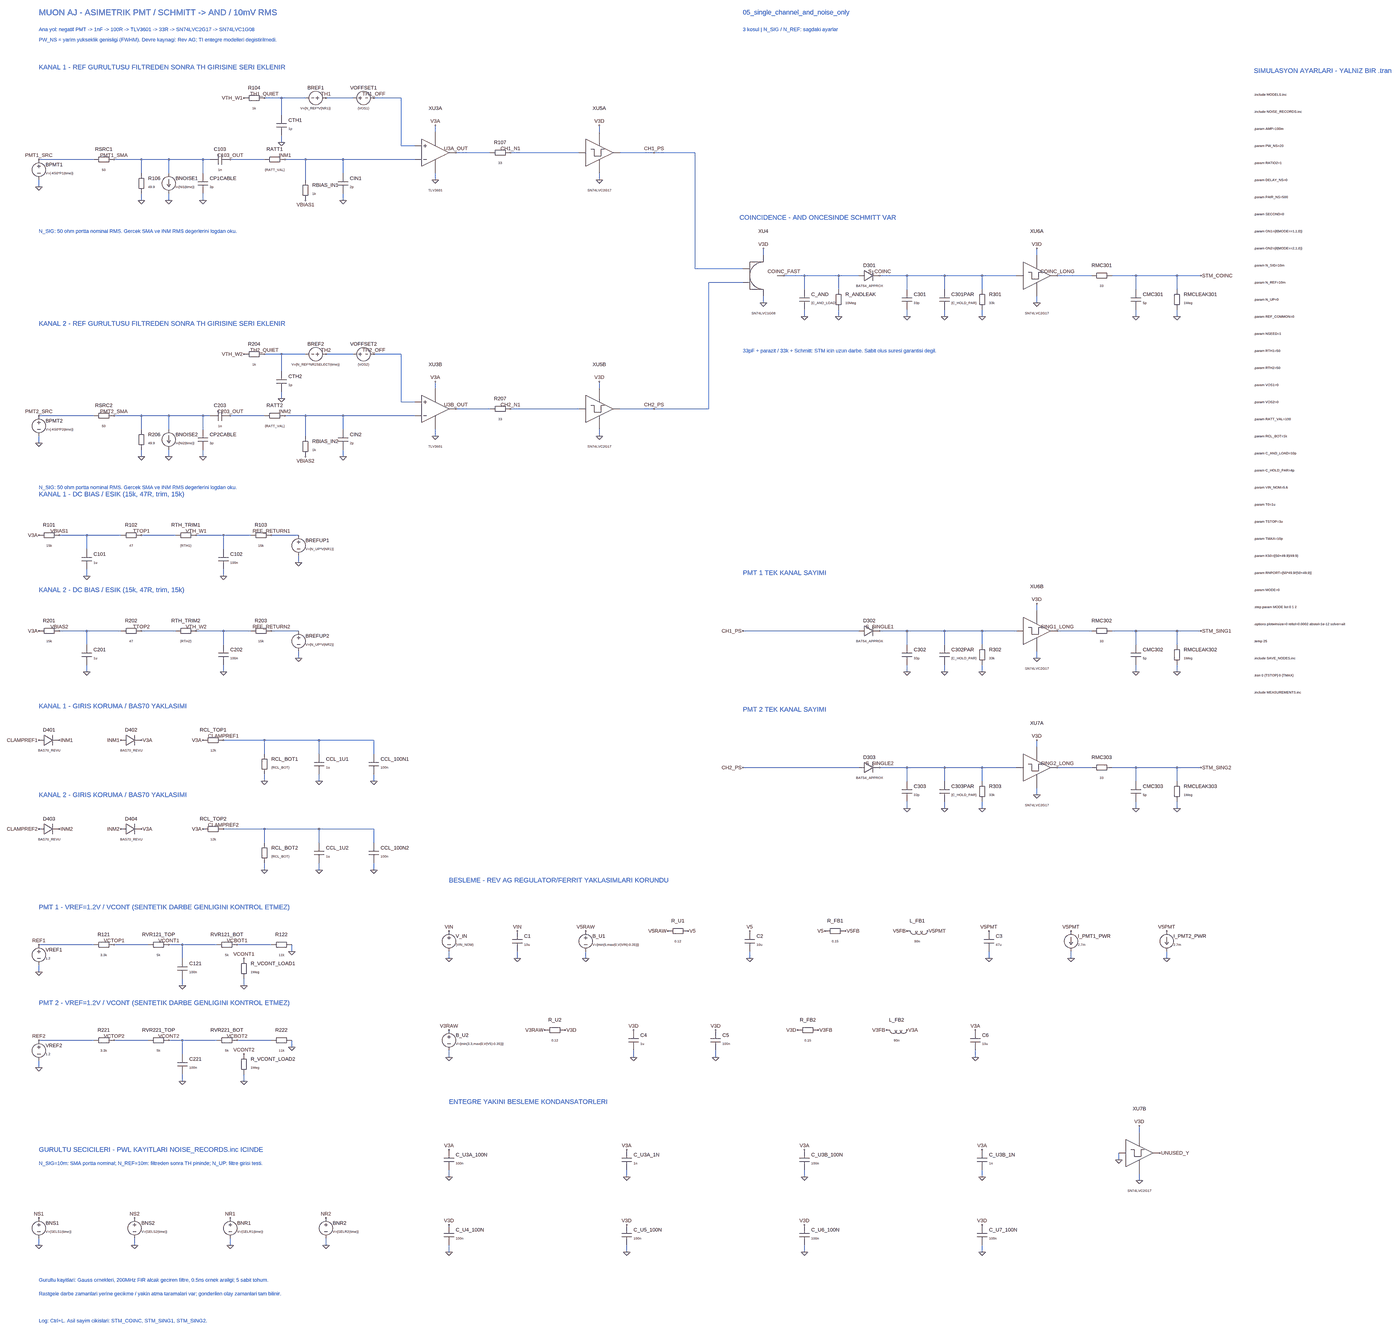
[diagram p0: schematic 05_single_channel_and_noise_only.asc, whole sheet]
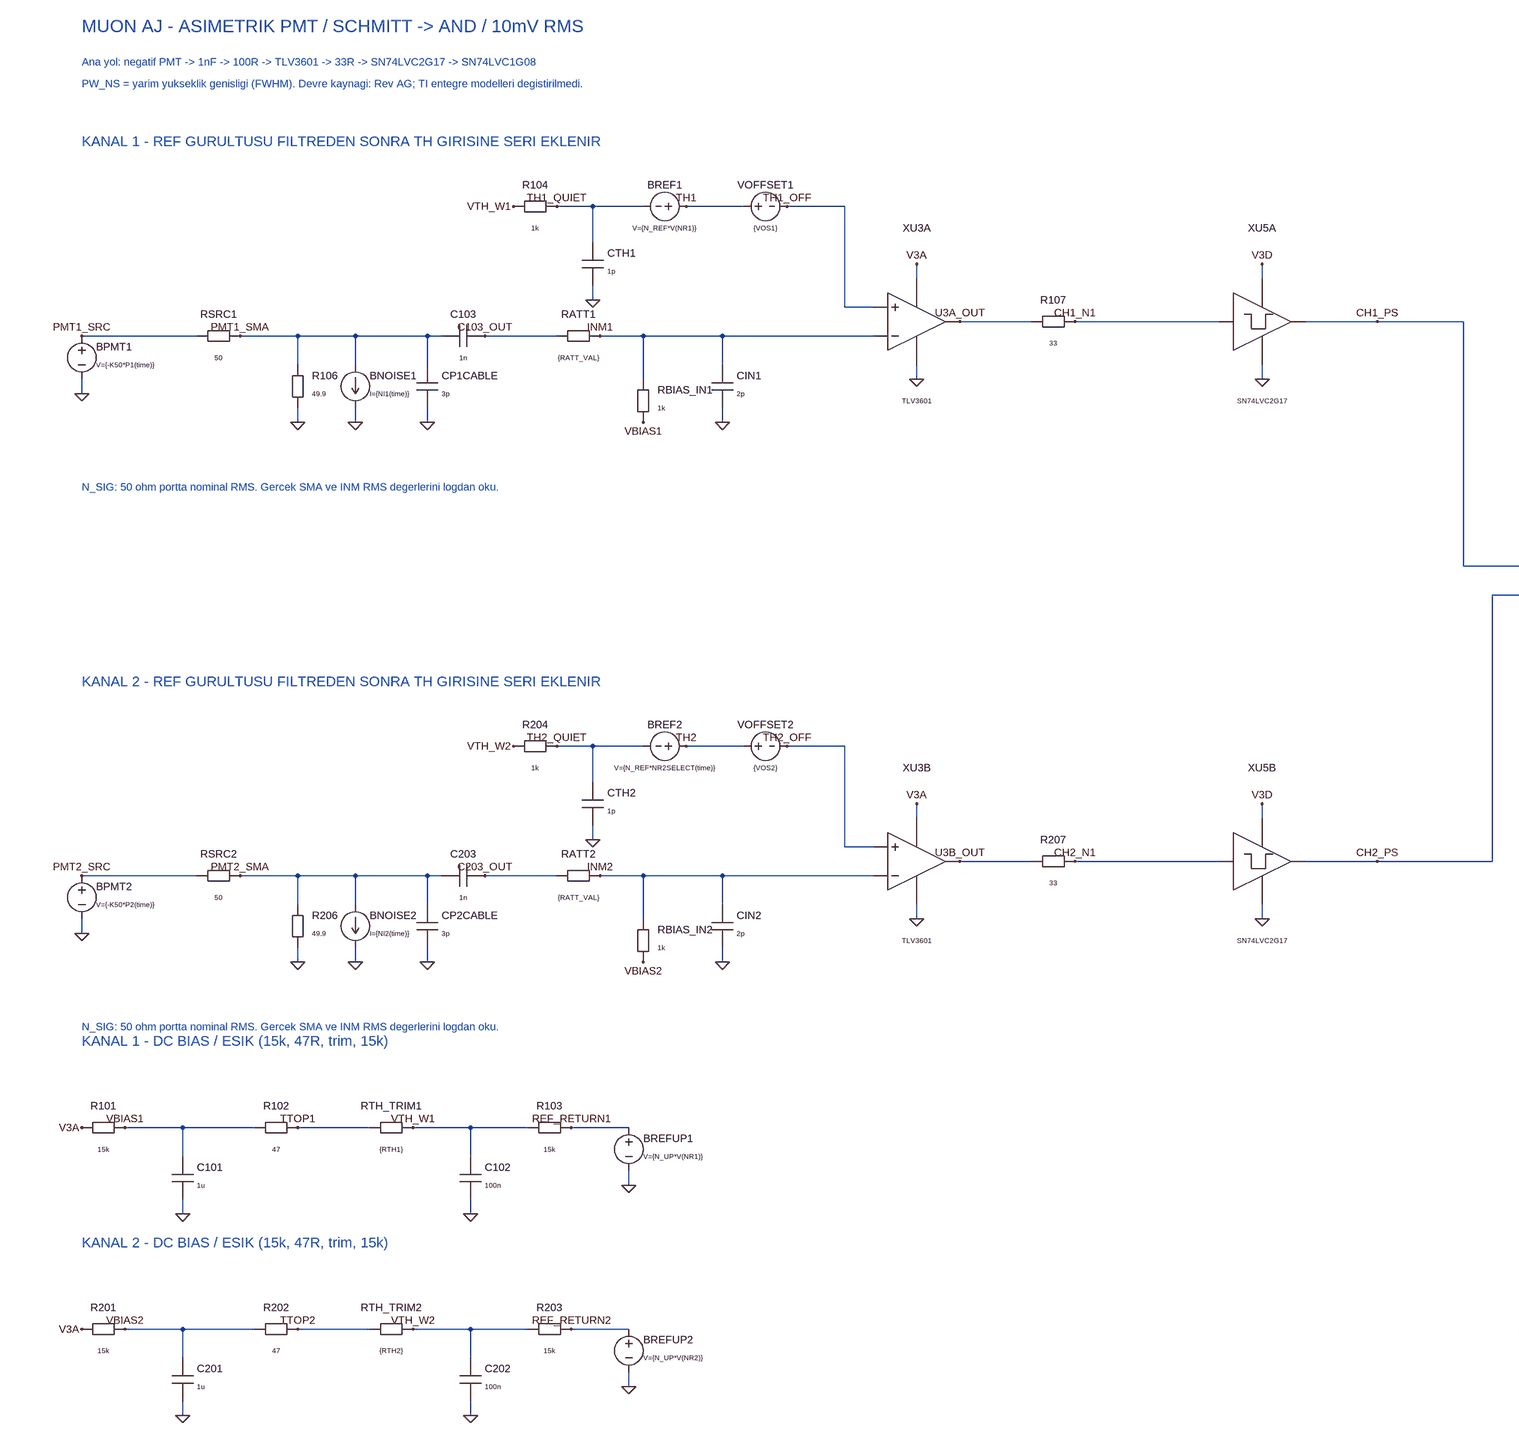
[diagram p1: schematic 05_single_channel_and_noise_only.asc, part, row 1 of 2, column 1 of 2]
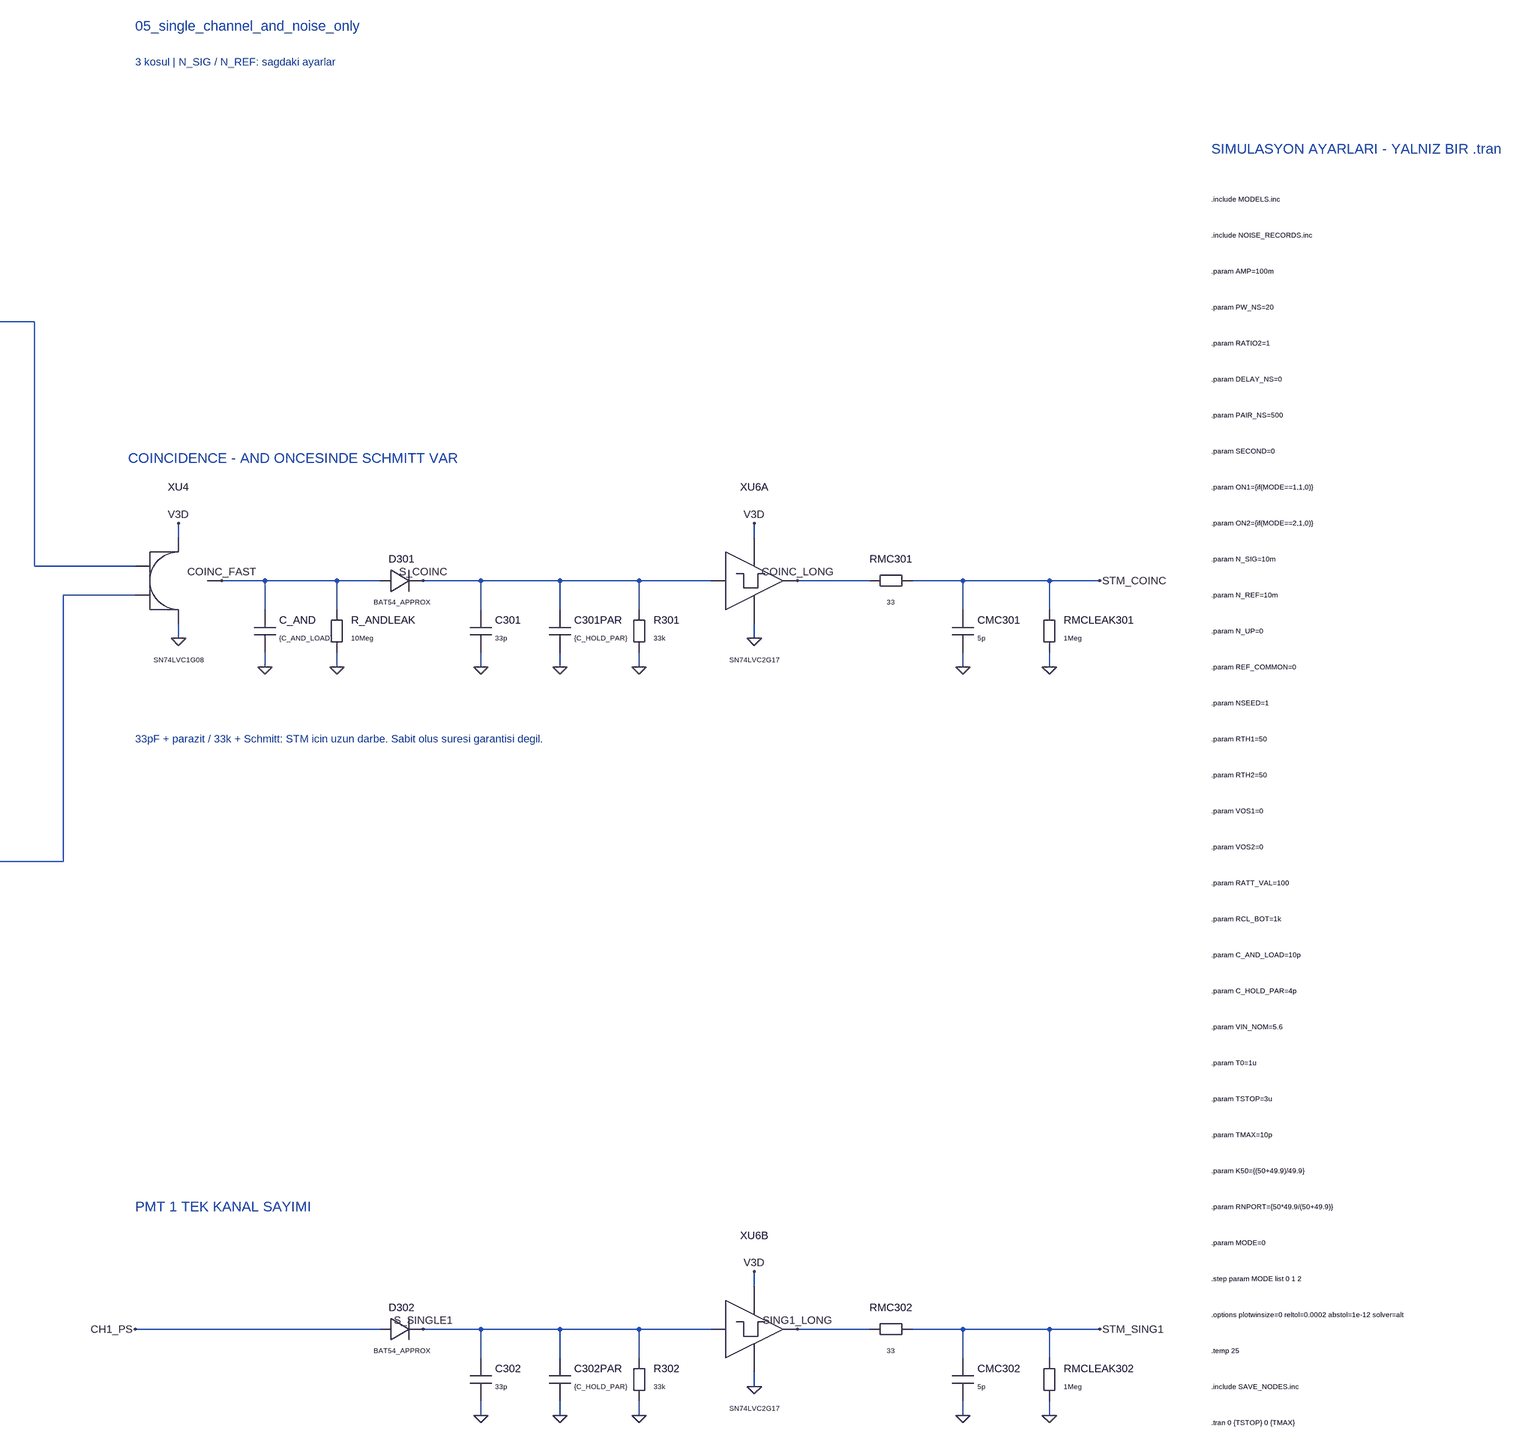
[diagram p2: schematic 05_single_channel_and_noise_only.asc, part, row 1 of 2, column 2 of 2]
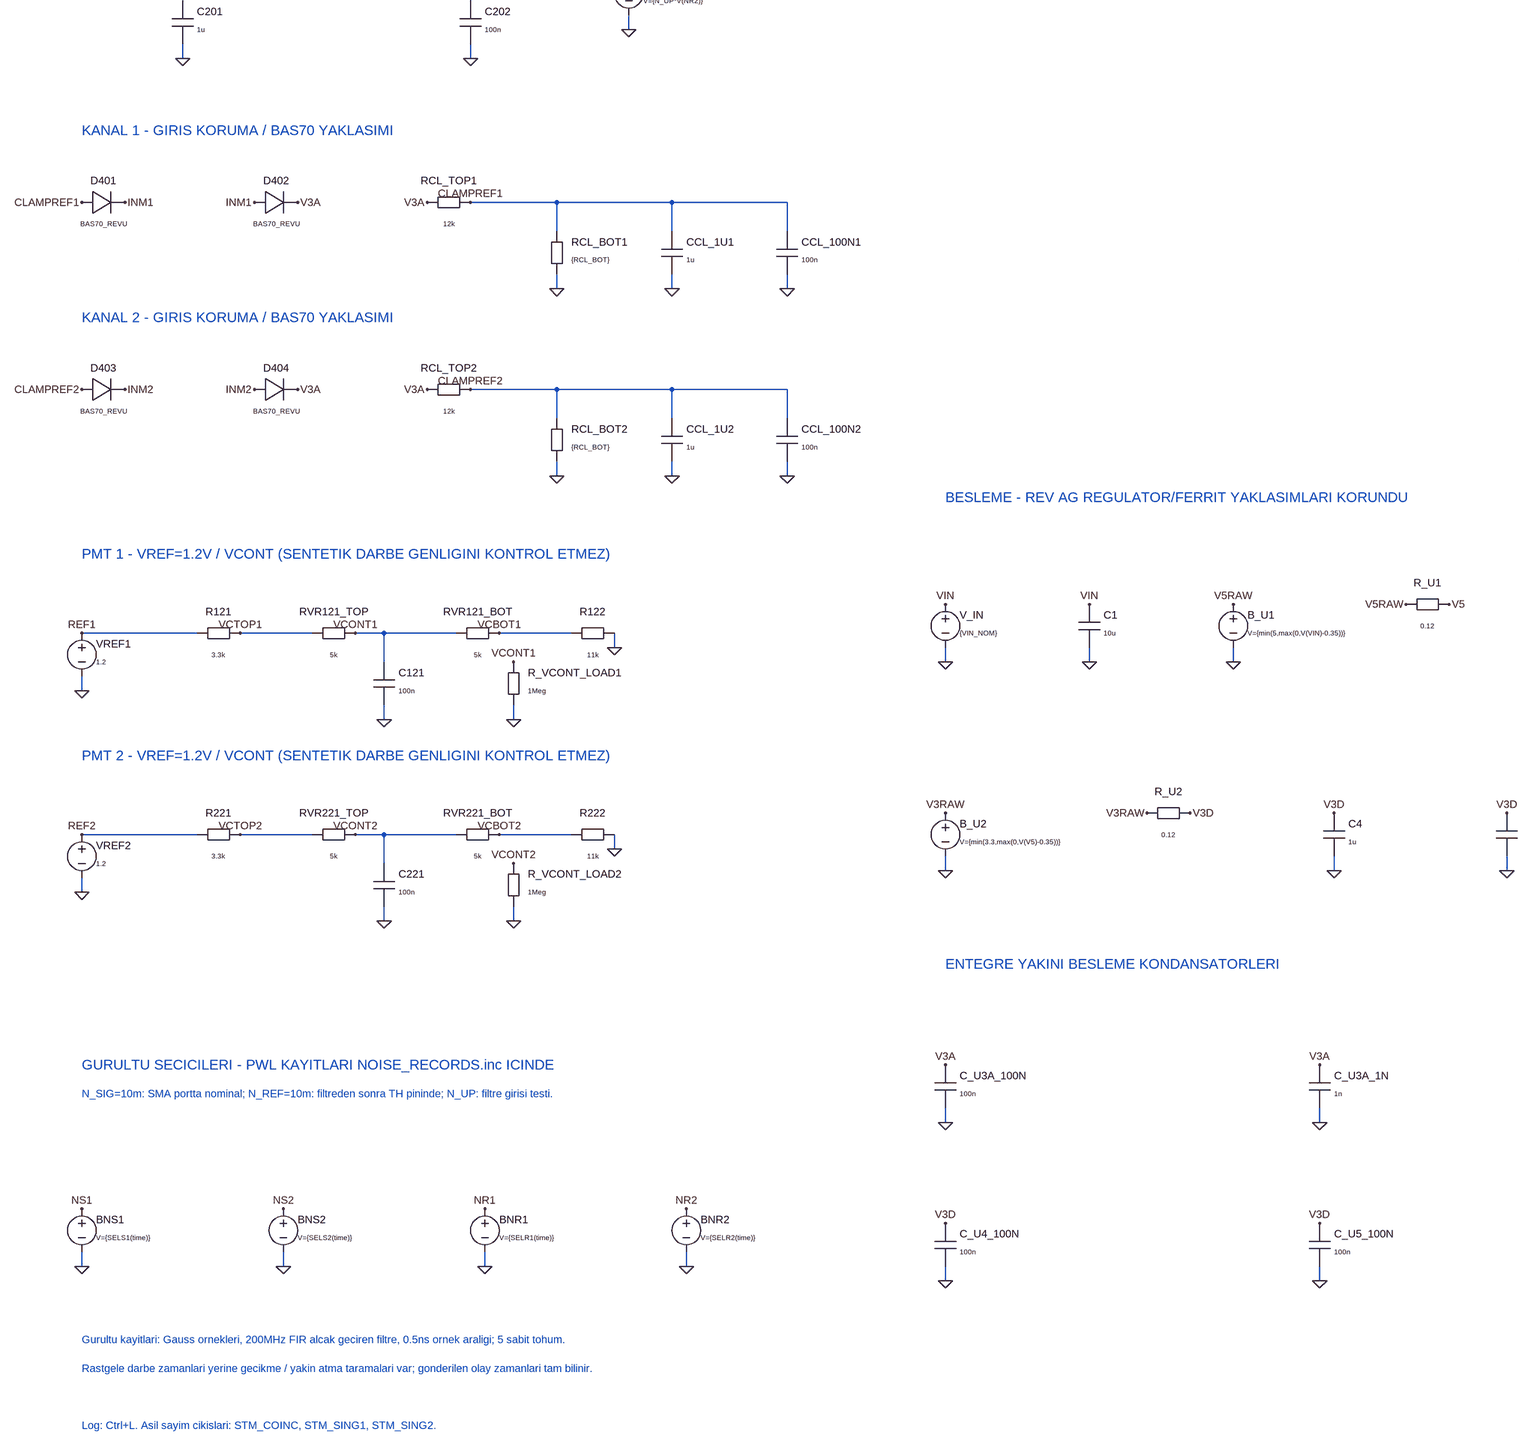
[diagram p3: schematic 05_single_channel_and_noise_only.asc, part, row 2 of 2, column 1 of 2]
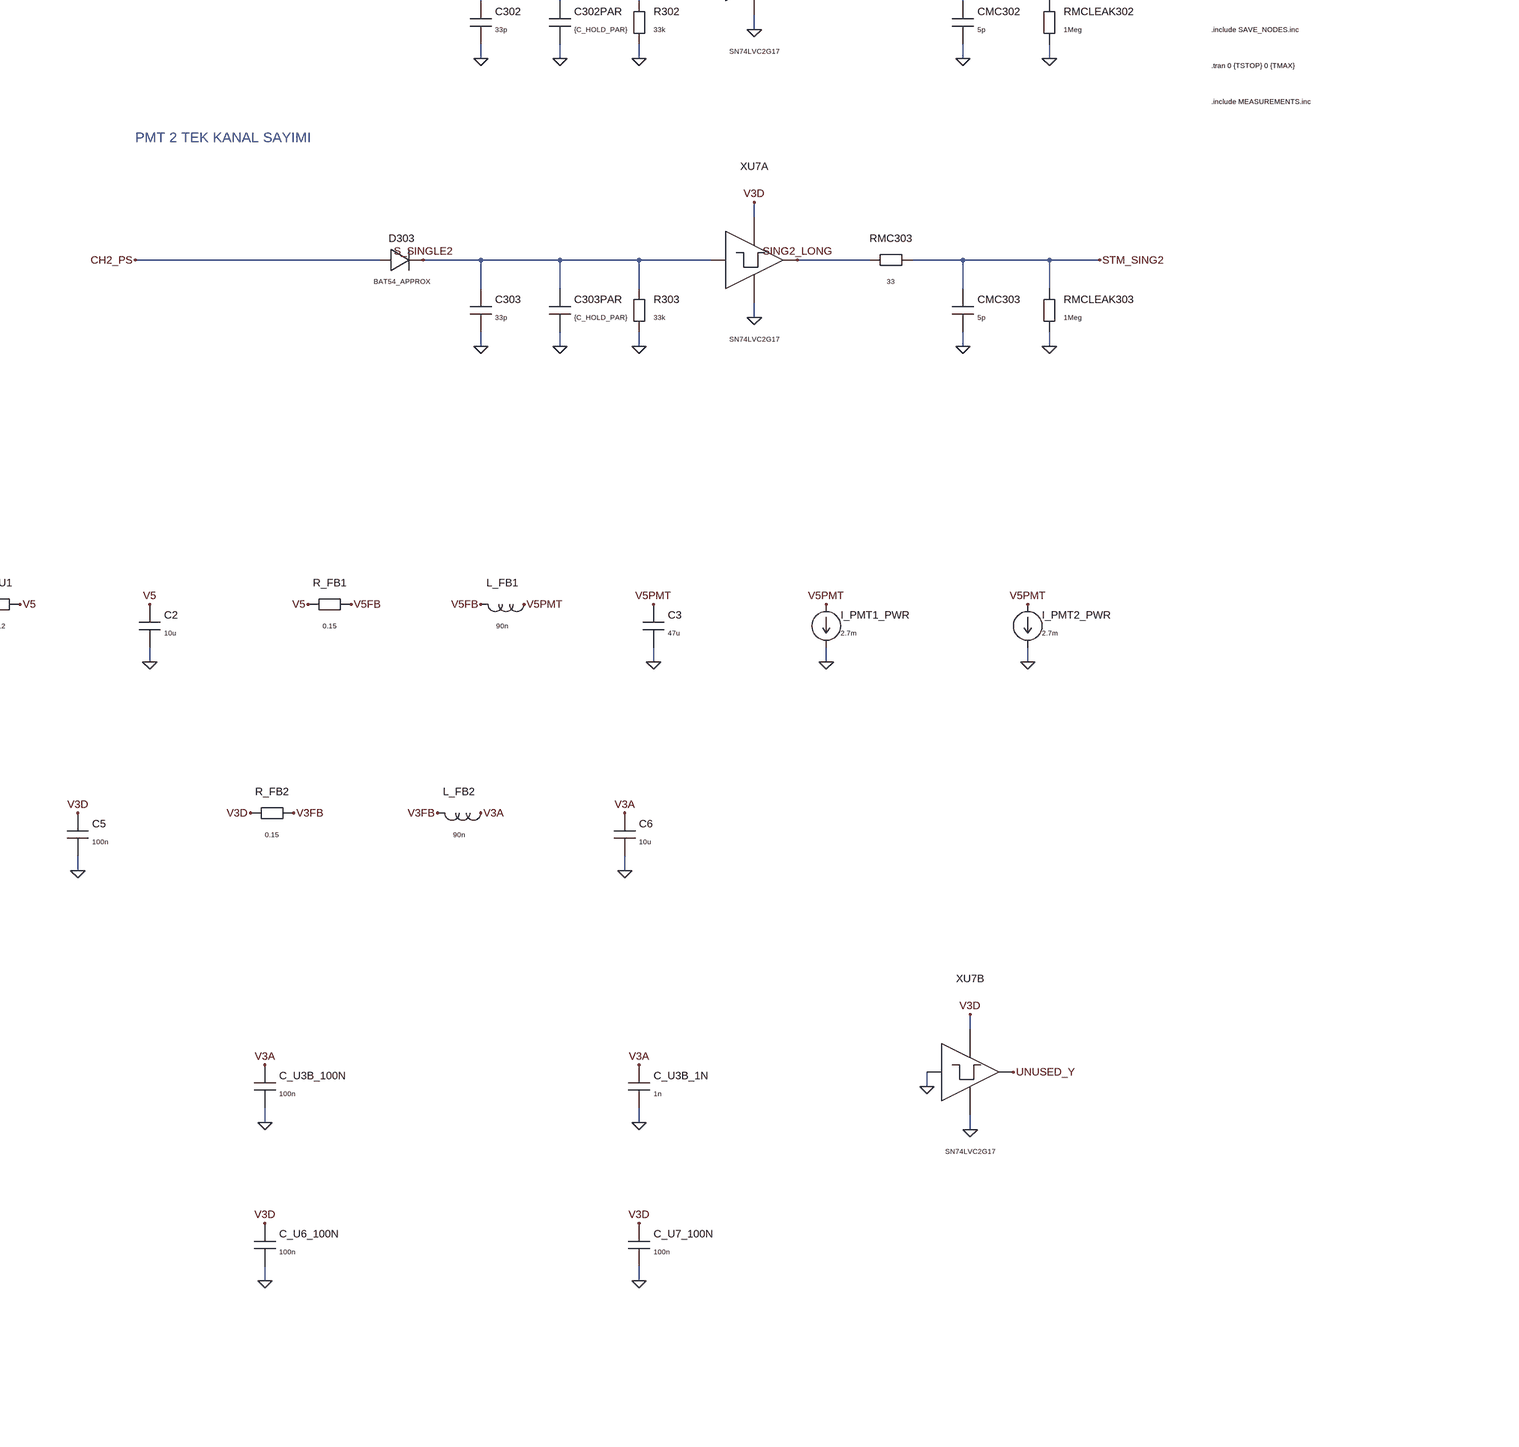
[diagram p4: schematic 05_single_channel_and_noise_only.asc, part, row 2 of 2, column 2 of 2]
05_single_channel_and_noise_only.asc, the LTspice schematic file:
Version 4
SHEET 1 8416 7424
WIRE 1184 512 1376 512
WIRE 1472 512 1600 512
WIRE 1696 512 1824 512
WIRE 1824 512 1824 736
WIRE 1824 736 1888 736
WIRE 1264 688 1264 720
WIRE 1264 512 1264 592
WIRE 128 896 128 928
WIRE 128 800 384 800
WIRE 480 800 928 800
WIRE 608 960 608 992
WIRE 608 800 608 864
WIRE 736 960 736 992
WIRE 736 800 736 864
WIRE 896 960 896 992
WIRE 896 800 896 864
WIRE 1024 800 1184 800
WIRE 1280 800 1888 800
WIRE 1376 800 1376 896
WIRE 1552 960 1552 992
WIRE 1552 800 1552 864
WIRE 1984 672 1984 640
WIRE 1984 864 1984 896
WIRE 2080 768 2240 768
WIRE 2336 768 2656 768
WIRE 2752 672 2752 640
WIRE 2752 864 2752 896
WIRE 2848 768 3200 768
WIRE 1184 1712 1376 1712
WIRE 1472 1712 1600 1712
WIRE 1696 1712 1824 1712
WIRE 1824 1712 1824 1936
WIRE 1824 1936 1888 1936
WIRE 1264 1888 1264 1920
WIRE 1264 1712 1264 1792
WIRE 128 2096 128 2128
WIRE 128 2000 384 2000
WIRE 480 2000 928 2000
WIRE 608 2160 608 2192
WIRE 608 2000 608 2064
WIRE 736 2160 736 2192
WIRE 736 2000 736 2064
WIRE 896 2160 896 2192
WIRE 896 2000 896 2064
WIRE 1024 2000 1184 2000
WIRE 1280 2000 1888 2000
WIRE 1376 2000 1376 2096
WIRE 1552 2160 1552 2192
WIRE 1552 2000 1552 2064
WIRE 1984 1872 1984 1840
WIRE 1984 2064 1984 2096
WIRE 2080 1968 2240 1968
WIRE 2336 1968 2656 1968
WIRE 2752 1872 2752 1840
WIRE 2752 2064 2752 2096
WIRE 2848 1968 3264 1968
WIRE 3200 768 3200 1312
WIRE 3200 1312 3424 1312
WIRE 3264 1968 3264 1376
WIRE 3264 1376 3424 1376
WIRE 3520 1248 3520 1216
WIRE 3520 1440 3520 1472
WIRE 3616 1344 3968 1344
WIRE 3712 1504 3712 1536
WIRE 3712 1344 3712 1408
WIRE 3872 1504 3872 1536
WIRE 3872 1344 3872 1408
WIRE 4064 1344 4704 1344
WIRE 4192 1504 4192 1536
WIRE 4192 1344 4192 1408
WIRE 4368 1504 4368 1536
WIRE 4368 1344 4368 1408
WIRE 4544 1504 4544 1536
WIRE 4544 1344 4544 1408
WIRE 4800 1248 4800 1216
WIRE 4800 1440 4800 1472
WIRE 4896 1344 5056 1344
WIRE 5152 1344 5568 1344
WIRE 5264 1504 5264 1536
WIRE 5264 1344 5264 1408
WIRE 5456 1504 5456 1536
WIRE 5456 1344 5456 1408
WIRE 3424 3008 3968 3008
WIRE 4064 3008 4704 3008
WIRE 4192 3168 4192 3200
WIRE 4192 3008 4192 3072
WIRE 4368 3168 4368 3200
WIRE 4368 3008 4368 3072
WIRE 4544 3168 4544 3200
WIRE 4544 3008 4544 3072
WIRE 4800 2912 4800 2880
WIRE 4800 3104 4800 3136
WIRE 4896 3008 5056 3008
WIRE 5152 3008 5568 3008
WIRE 5264 3168 5264 3200
WIRE 5264 3008 5264 3072
WIRE 5456 3168 5456 3200
WIRE 5456 3008 5456 3072
WIRE 3424 3648 3968 3648
WIRE 4064 3648 4704 3648
WIRE 4192 3808 4192 3840
WIRE 4192 3648 4192 3712
WIRE 4368 3808 4368 3840
WIRE 4368 3648 4368 3712
WIRE 4544 3808 4544 3840
WIRE 4544 3648 4544 3712
WIRE 4800 3552 4800 3520
WIRE 4800 3744 4800 3776
WIRE 4896 3648 5056 3648
WIRE 5152 3648 5568 3648
WIRE 5264 3808 5264 3840
WIRE 5264 3648 5264 3712
WIRE 5456 3808 5456 3840
WIRE 5456 3648 5456 3712
WIRE 224 2560 512 2560
WIRE 608 2560 768 2560
WIRE 864 2560 1120 2560
WIRE 1216 2560 1344 2560
WIRE 1344 2656 1344 2688
WIRE 352 2720 352 2752
WIRE 352 2560 352 2624
WIRE 992 2720 992 2752
WIRE 992 2560 992 2624
WIRE 224 3008 512 3008
WIRE 608 3008 768 3008
WIRE 864 3008 1120 3008
WIRE 1216 3008 1344 3008
WIRE 1344 3104 1344 3136
WIRE 352 3168 352 3200
WIRE 352 3008 352 3072
WIRE 992 3168 992 3200
WIRE 992 3008 992 3072
WIRE 1184 3680 1184 3712
WIRE 1440 3680 1440 3712
WIRE 1696 3680 1696 3712
WIRE 992 3520 1696 3520
WIRE 1184 3520 1184 3584
WIRE 1440 3520 1440 3584
WIRE 1696 3520 1696 3584
WIRE 1184 4096 1184 4128
WIRE 1440 4096 1440 4128
WIRE 1696 4096 1696 4128
WIRE 992 3936 1696 3936
WIRE 1184 3936 1184 4000
WIRE 1440 3936 1440 4000
WIRE 1696 3936 1696 4000
WIRE 128 4592 128 4624
WIRE 128 4496 384 4496
WIRE 480 4496 640 4496
WIRE 736 4496 960 4496
WIRE 1056 4496 1216 4496
WIRE 1312 4496 1312 4528
WIRE 800 4656 800 4688
WIRE 800 4496 800 4560
WIRE 1088 4656 1088 4688
WIRE 128 5040 128 5072
WIRE 128 4944 384 4944
WIRE 480 4944 640 4944
WIRE 736 4944 960 4944
WIRE 1056 4944 1216 4944
WIRE 1312 4944 1312 4976
WIRE 800 5104 800 5136
WIRE 800 4944 800 5008
WIRE 1088 5104 1088 5136
WIRE 2048 4528 2048 4560
WIRE 2368 4528 2368 4560
WIRE 2688 4528 2688 4560
WIRE 3456 4528 3456 4560
WIRE 4576 4528 4576 4560
WIRE 4960 4528 4960 4560
WIRE 5408 4528 5408 4560
WIRE 2048 4992 2048 5024
WIRE 2912 4992 2912 5024
WIRE 3296 4992 3296 5024
WIRE 4512 4992 4512 5024
WIRE 2048 5552 2048 5584
WIRE 2880 5552 2880 5584
WIRE 3712 5552 3712 5584
WIRE 4544 5552 4544 5584
WIRE 2048 5904 2048 5936
WIRE 2880 5904 2880 5936
WIRE 3712 5904 3712 5936
WIRE 4544 5904 4544 5936
WIRE 5184 5472 5184 5504
WIRE 5280 5376 5280 5344
WIRE 5280 5568 5280 5600
WIRE 128 5872 128 5904
WIRE 576 5872 576 5904
WIRE 1024 5872 1024 5904
WIRE 1472 5872 1472 5904
FLAG 1088 512 VTH_W1
FLAG 1184 512 TH1_QUIET
FLAG 1472 512 TH1
FLAG 1696 512 TH1_OFF
FLAG 1264 720 0
FLAG 128 800 PMT1_SRC
FLAG 128 928 0
FLAG 480 800 PMT1_SMA
FLAG 608 992 0
FLAG 736 992 0
FLAG 896 992 0
FLAG 1024 800 C103_OUT
FLAG 1280 800 INM1
FLAG 1376 992 VBIAS1
FLAG 1552 992 0
FLAG 1984 640 V3A
FLAG 1984 896 0
FLAG 2080 768 U3A_OUT
FLAG 2336 768 CH1_N1
FLAG 3008 768 CH1_PS
FLAG 2752 640 V3D
FLAG 2752 896 0
FLAG 1088 1712 VTH_W2
FLAG 1184 1712 TH2_QUIET
FLAG 1472 1712 TH2
FLAG 1696 1712 TH2_OFF
FLAG 1264 1920 0
FLAG 128 2000 PMT2_SRC
FLAG 128 2128 0
FLAG 480 2000 PMT2_SMA
FLAG 608 2192 0
FLAG 736 2192 0
FLAG 896 2192 0
FLAG 1024 2000 C203_OUT
FLAG 1280 2000 INM2
FLAG 1376 2192 VBIAS2
FLAG 1552 2192 0
FLAG 1984 1840 V3A
FLAG 1984 2096 0
FLAG 2080 1968 U3B_OUT
FLAG 2336 1968 CH2_N1
FLAG 3008 1968 CH2_PS
FLAG 2752 1840 V3D
FLAG 2752 2096 0
FLAG 3616 1344 COINC_FAST
FLAG 3520 1216 V3D
FLAG 3520 1472 0
FLAG 3712 1536 0
FLAG 3872 1536 0
FLAG 4064 1344 S_COINC
FLAG 4192 1536 0
FLAG 4368 1536 0
FLAG 4544 1536 0
FLAG 4896 1344 COINC_LONG
FLAG 4800 1216 V3D
FLAG 4800 1472 0
FLAG 5568 1344 STM_COINC
FLAG 5264 1536 0
FLAG 5456 1536 0
FLAG 3424 3008 CH1_PS
FLAG 4064 3008 S_SINGLE1
FLAG 4192 3200 0
FLAG 4368 3200 0
FLAG 4544 3200 0
FLAG 4896 3008 SING1_LONG
FLAG 4800 2880 V3D
FLAG 4800 3136 0
FLAG 5568 3008 STM_SING1
FLAG 5264 3200 0
FLAG 5456 3200 0
FLAG 3424 3648 CH2_PS
FLAG 4064 3648 S_SINGLE2
FLAG 4192 3840 0
FLAG 4368 3840 0
FLAG 4544 3840 0
FLAG 4896 3648 SING2_LONG
FLAG 4800 3520 V3D
FLAG 4800 3776 0
FLAG 5568 3648 STM_SING2
FLAG 5264 3840 0
FLAG 5456 3840 0
FLAG 128 2560 V3A
FLAG 224 2560 VBIAS1
FLAG 608 2560 TTOP1
FLAG 864 2560 VTH_W1
FLAG 1216 2560 REF_RETURN1
FLAG 1344 2688 0
FLAG 352 2752 0
FLAG 992 2752 0
FLAG 128 3008 V3A
FLAG 224 3008 VBIAS2
FLAG 608 3008 TTOP2
FLAG 864 3008 VTH_W2
FLAG 1216 3008 REF_RETURN2
FLAG 1344 3136 0
FLAG 352 3200 0
FLAG 992 3200 0
FLAG 128 3520 CLAMPREF1
FLAG 224 3520 INM1
FLAG 512 3520 INM1
FLAG 608 3520 V3A
FLAG 896 3520 V3A
FLAG 992 3520 CLAMPREF1
FLAG 1184 3712 0
FLAG 1440 3712 0
FLAG 1696 3712 0
FLAG 128 3936 CLAMPREF2
FLAG 224 3936 INM2
FLAG 512 3936 INM2
FLAG 608 3936 V3A
FLAG 896 3936 V3A
FLAG 992 3936 CLAMPREF2
FLAG 1184 4128 0
FLAG 1440 4128 0
FLAG 1696 4128 0
FLAG 128 4496 REF1
FLAG 128 4624 0
FLAG 480 4496 VCTOP1
FLAG 736 4496 VCONT1
FLAG 1056 4496 VCBOT1
FLAG 1312 4528 0
FLAG 800 4688 0
FLAG 1088 4560 VCONT1
FLAG 1088 4688 0
FLAG 128 4944 REF2
FLAG 128 5072 0
FLAG 480 4944 VCTOP2
FLAG 736 4944 VCONT2
FLAG 1056 4944 VCBOT2
FLAG 1312 4976 0
FLAG 800 5136 0
FLAG 1088 5008 VCONT2
FLAG 1088 5136 0
FLAG 2048 4432 VIN
FLAG 2048 4560 0
FLAG 2368 4432 VIN
FLAG 2368 4560 0
FLAG 2688 4432 V5RAW
FLAG 2688 4560 0
FLAG 3072 4432 V5RAW
FLAG 3168 4432 V5
FLAG 3456 4432 V5
FLAG 3456 4560 0
FLAG 3808 4432 V5
FLAG 3904 4432 V5FB
FLAG 4192 4432 V5FB
FLAG 4288 4432 V5PMT
FLAG 4576 4432 V5PMT
FLAG 4576 4560 0
FLAG 4960 4432 V5PMT
FLAG 4960 4560 0
FLAG 5408 4432 V5PMT
FLAG 5408 4560 0
FLAG 2048 4896 V3RAW
FLAG 2048 5024 0
FLAG 2496 4896 V3RAW
FLAG 2592 4896 V3D
FLAG 2912 4896 V3D
FLAG 2912 5024 0
FLAG 3296 4896 V3D
FLAG 3296 5024 0
FLAG 3680 4896 V3D
FLAG 3776 4896 V3FB
FLAG 4096 4896 V3FB
FLAG 4192 4896 V3A
FLAG 4512 4896 V3A
FLAG 4512 5024 0
FLAG 2048 5456 V3A
FLAG 2048 5584 0
FLAG 2880 5456 V3A
FLAG 2880 5584 0
FLAG 3712 5456 V3A
FLAG 3712 5584 0
FLAG 4544 5456 V3A
FLAG 4544 5584 0
FLAG 2048 5808 V3D
FLAG 2048 5936 0
FLAG 2880 5808 V3D
FLAG 2880 5936 0
FLAG 3712 5808 V3D
FLAG 3712 5936 0
FLAG 4544 5808 V3D
FLAG 4544 5936 0
FLAG 5376 5472 UNUSED_Y
FLAG 5184 5504 0
FLAG 5280 5344 V3D
FLAG 5280 5600 0
FLAG 128 5776 NS1
FLAG 128 5904 0
FLAG 576 5776 NS2
FLAG 576 5904 0
FLAG 1024 5776 NR1
FLAG 1024 5904 0
FLAG 1472 5776 NR2
FLAG 1472 5904 0
SYMBOL AJ_RH 1088 512 R0
SYMATTR InstName R104
SYMATTR Value 1k
SYMBOL AJ_BH 1376 512 R0
SYMATTR InstName BREF1
SYMATTR Value V={N_REF*V(NR1)}
SYMBOL AJ_VH 1600 512 R0
SYMATTR InstName VOFFSET1
SYMATTR Value {VOS1}
SYMBOL AJ_CV 1264 592 R0
SYMATTR InstName CTH1
SYMATTR Value 1p
SYMBOL AJ_BV 128 800 R0
SYMATTR InstName BPMT1
SYMATTR Value V={-K50*P1(time)}
SYMBOL AJ_RH 384 800 R0
SYMATTR InstName RSRC1
SYMATTR Value 50
SYMBOL AJ_RV 608 864 R0
SYMATTR InstName R106
SYMATTR Value 49.9
SYMBOL AJ_BI 736 864 R0
SYMATTR InstName BNOISE1
SYMATTR Value I={NI1(time)}
SYMBOL AJ_CV 896 864 R0
SYMATTR InstName CP1CABLE
SYMATTR Value 3p
SYMBOL AJ_CH 928 800 R0
SYMATTR InstName C103
SYMATTR Value 1n
SYMBOL AJ_RH 1184 800 R0
SYMATTR InstName RATT1
SYMATTR Value {RATT_VAL}
SYMBOL AJ_RV 1376 896 R0
SYMATTR InstName RBIAS_IN1
SYMATTR Value 1k
SYMBOL AJ_CV 1552 864 R0
SYMATTR InstName CIN1
SYMATTR Value 2p
SYMBOL AJ_TLV3601 1888 704 R0
SYMATTR InstName XU3A
SYMATTR Value TLV3601
SYMBOL AJ_RH 2240 768 R0
SYMATTR InstName R107
SYMATTR Value 33
SYMBOL AJ_SCHMITT 2656 704 R0
SYMATTR InstName XU5A
SYMATTR Value SN74LVC2G17
SYMBOL AJ_RH 1088 1712 R0
SYMATTR InstName R204
SYMATTR Value 1k
SYMBOL AJ_BH 1376 1712 R0
SYMATTR InstName BREF2
SYMATTR Value V={N_REF*NR2SELECT(time)}
SYMBOL AJ_VH 1600 1712 R0
SYMATTR InstName VOFFSET2
SYMATTR Value {VOS2}
SYMBOL AJ_CV 1264 1792 R0
SYMATTR InstName CTH2
SYMATTR Value 1p
SYMBOL AJ_BV 128 2000 R0
SYMATTR InstName BPMT2
SYMATTR Value V={-K50*P2(time)}
SYMBOL AJ_RH 384 2000 R0
SYMATTR InstName RSRC2
SYMATTR Value 50
SYMBOL AJ_RV 608 2064 R0
SYMATTR InstName R206
SYMATTR Value 49.9
SYMBOL AJ_BI 736 2064 R0
SYMATTR InstName BNOISE2
SYMATTR Value I={NI2(time)}
SYMBOL AJ_CV 896 2064 R0
SYMATTR InstName CP2CABLE
SYMATTR Value 3p
SYMBOL AJ_CH 928 2000 R0
SYMATTR InstName C203
SYMATTR Value 1n
SYMBOL AJ_RH 1184 2000 R0
SYMATTR InstName RATT2
SYMATTR Value {RATT_VAL}
SYMBOL AJ_RV 1376 2096 R0
SYMATTR InstName RBIAS_IN2
SYMATTR Value 1k
SYMBOL AJ_CV 1552 2064 R0
SYMATTR InstName CIN2
SYMATTR Value 2p
SYMBOL AJ_TLV3601 1888 1904 R0
SYMATTR InstName XU3B
SYMATTR Value TLV3601
SYMBOL AJ_RH 2240 1968 R0
SYMATTR InstName R207
SYMATTR Value 33
SYMBOL AJ_SCHMITT 2656 1904 R0
SYMATTR InstName XU5B
SYMATTR Value SN74LVC2G17
SYMBOL AJ_AND 3424 1280 R0
SYMATTR InstName XU4
SYMATTR Value SN74LVC1G08
SYMBOL AJ_CV 3712 1408 R0
SYMATTR InstName C_AND
SYMATTR Value {C_AND_LOAD}
SYMBOL AJ_RV 3872 1408 R0
SYMATTR InstName R_ANDLEAK
SYMATTR Value 10Meg
SYMBOL AJ_DH 3968 1344 R0
SYMATTR InstName D301
SYMATTR Value BAT54_APPROX
SYMBOL AJ_CV 4192 1408 R0
SYMATTR InstName C301
SYMATTR Value 33p
SYMBOL AJ_CV 4368 1408 R0
SYMATTR InstName C301PAR
SYMATTR Value {C_HOLD_PAR}
SYMBOL AJ_RV 4544 1408 R0
SYMATTR InstName R301
SYMATTR Value 33k
SYMBOL AJ_SCHMITT 4704 1280 R0
SYMATTR InstName XU6A
SYMATTR Value SN74LVC2G17
SYMBOL AJ_RH 5056 1344 R0
SYMATTR InstName RMC301
SYMATTR Value 33
SYMBOL AJ_CV 5264 1408 R0
SYMATTR InstName CMC301
SYMATTR Value 5p
SYMBOL AJ_RV 5456 1408 R0
SYMATTR InstName RMCLEAK301
SYMATTR Value 1Meg
SYMBOL AJ_DH 3968 3008 R0
SYMATTR InstName D302
SYMATTR Value BAT54_APPROX
SYMBOL AJ_CV 4192 3072 R0
SYMATTR InstName C302
SYMATTR Value 33p
SYMBOL AJ_CV 4368 3072 R0
SYMATTR InstName C302PAR
SYMATTR Value {C_HOLD_PAR}
SYMBOL AJ_RV 4544 3072 R0
SYMATTR InstName R302
SYMATTR Value 33k
SYMBOL AJ_SCHMITT 4704 2944 R0
SYMATTR InstName XU6B
SYMATTR Value SN74LVC2G17
SYMBOL AJ_RH 5056 3008 R0
SYMATTR InstName RMC302
SYMATTR Value 33
SYMBOL AJ_CV 5264 3072 R0
SYMATTR InstName CMC302
SYMATTR Value 5p
SYMBOL AJ_RV 5456 3072 R0
SYMATTR InstName RMCLEAK302
SYMATTR Value 1Meg
SYMBOL AJ_DH 3968 3648 R0
SYMATTR InstName D303
SYMATTR Value BAT54_APPROX
SYMBOL AJ_CV 4192 3712 R0
SYMATTR InstName C303
SYMATTR Value 33p
SYMBOL AJ_CV 4368 3712 R0
SYMATTR InstName C303PAR
SYMATTR Value {C_HOLD_PAR}
SYMBOL AJ_RV 4544 3712 R0
SYMATTR InstName R303
SYMATTR Value 33k
SYMBOL AJ_SCHMITT 4704 3584 R0
SYMATTR InstName XU7A
SYMATTR Value SN74LVC2G17
SYMBOL AJ_RH 5056 3648 R0
SYMATTR InstName RMC303
SYMATTR Value 33
SYMBOL AJ_CV 5264 3712 R0
SYMATTR InstName CMC303
SYMATTR Value 5p
SYMBOL AJ_RV 5456 3712 R0
SYMATTR InstName RMCLEAK303
SYMATTR Value 1Meg
SYMBOL AJ_RH 128 2560 R0
SYMATTR InstName R101
SYMATTR Value 15k
SYMBOL AJ_RH 512 2560 R0
SYMATTR InstName R102
SYMATTR Value 47
SYMBOL AJ_RH 768 2560 R0
SYMATTR InstName RTH_TRIM1
SYMATTR Value {RTH1}
SYMBOL AJ_RH 1120 2560 R0
SYMATTR InstName R103
SYMATTR Value 15k
SYMBOL AJ_BV 1344 2560 R0
SYMATTR InstName BREFUP1
SYMATTR Value V={N_UP*V(NR1)}
SYMBOL AJ_CV 352 2624 R0
SYMATTR InstName C101
SYMATTR Value 1u
SYMBOL AJ_CV 992 2624 R0
SYMATTR InstName C102
SYMATTR Value 100n
SYMBOL AJ_RH 128 3008 R0
SYMATTR InstName R201
SYMATTR Value 15k
SYMBOL AJ_RH 512 3008 R0
SYMATTR InstName R202
SYMATTR Value 47
SYMBOL AJ_RH 768 3008 R0
SYMATTR InstName RTH_TRIM2
SYMATTR Value {RTH2}
SYMBOL AJ_RH 1120 3008 R0
SYMATTR InstName R203
SYMATTR Value 15k
SYMBOL AJ_BV 1344 3008 R0
SYMATTR InstName BREFUP2
SYMATTR Value V={N_UP*V(NR2)}
SYMBOL AJ_CV 352 3072 R0
SYMATTR InstName C201
SYMATTR Value 1u
SYMBOL AJ_CV 992 3072 R0
SYMATTR InstName C202
SYMATTR Value 100n
SYMBOL AJ_DH 128 3520 R0
SYMATTR InstName D401
SYMATTR Value BAS70_REVU
SYMBOL AJ_DH 512 3520 R0
SYMATTR InstName D402
SYMATTR Value BAS70_REVU
SYMBOL AJ_RH 896 3520 R0
SYMATTR InstName RCL_TOP1
SYMATTR Value 12k
SYMBOL AJ_RV 1184 3584 R0
SYMATTR InstName RCL_BOT1
SYMATTR Value {RCL_BOT}
SYMBOL AJ_CV 1440 3584 R0
SYMATTR InstName CCL_1U1
SYMATTR Value 1u
SYMBOL AJ_CV 1696 3584 R0
SYMATTR InstName CCL_100N1
SYMATTR Value 100n
SYMBOL AJ_DH 128 3936 R0
SYMATTR InstName D403
SYMATTR Value BAS70_REVU
SYMBOL AJ_DH 512 3936 R0
SYMATTR InstName D404
SYMATTR Value BAS70_REVU
SYMBOL AJ_RH 896 3936 R0
SYMATTR InstName RCL_TOP2
SYMATTR Value 12k
SYMBOL AJ_RV 1184 4000 R0
SYMATTR InstName RCL_BOT2
SYMATTR Value {RCL_BOT}
SYMBOL AJ_CV 1440 4000 R0
SYMATTR InstName CCL_1U2
SYMATTR Value 1u
SYMBOL AJ_CV 1696 4000 R0
SYMATTR InstName CCL_100N2
SYMATTR Value 100n
SYMBOL AJ_VV 128 4496 R0
SYMATTR InstName VREF1
SYMATTR Value 1.2
SYMBOL AJ_RH 384 4496 R0
SYMATTR InstName R121
SYMATTR Value 3.3k
SYMBOL AJ_RH 640 4496 R0
SYMATTR InstName RVR121_TOP
SYMATTR Value 5k
SYMBOL AJ_RH 960 4496 R0
SYMATTR InstName RVR121_BOT
SYMATTR Value 5k
SYMBOL AJ_RH 1216 4496 R0
SYMATTR InstName R122
SYMATTR Value 11k
SYMBOL AJ_CV 800 4560 R0
SYMATTR InstName C121
SYMATTR Value 100n
SYMBOL AJ_RV 1088 4560 R0
SYMATTR InstName R_VCONT_LOAD1
SYMATTR Value 1Meg
SYMBOL AJ_VV 128 4944 R0
SYMATTR InstName VREF2
SYMATTR Value 1.2
SYMBOL AJ_RH 384 4944 R0
SYMATTR InstName R221
SYMATTR Value 3.3k
SYMBOL AJ_RH 640 4944 R0
SYMATTR InstName RVR221_TOP
SYMATTR Value 5k
SYMBOL AJ_RH 960 4944 R0
SYMATTR InstName RVR221_BOT
SYMATTR Value 5k
SYMBOL AJ_RH 1216 4944 R0
SYMATTR InstName R222
SYMATTR Value 11k
SYMBOL AJ_CV 800 5008 R0
SYMATTR InstName C221
SYMATTR Value 100n
SYMBOL AJ_RV 1088 5008 R0
SYMATTR InstName R_VCONT_LOAD2
SYMATTR Value 1Meg
SYMBOL AJ_VV 2048 4432 R0
SYMATTR InstName V_IN
SYMATTR Value {VIN_NOM}
SYMBOL AJ_CV 2368 4432 R0
SYMATTR InstName C1
SYMATTR Value 10u
SYMBOL AJ_BV 2688 4432 R0
SYMATTR InstName B_U1
SYMATTR Value V={min(5,max(0,V(VIN)-0.35))}
SYMBOL AJ_RH 3072 4432 R0
SYMATTR InstName R_U1
SYMATTR Value 0.12
SYMBOL AJ_CV 3456 4432 R0
SYMATTR InstName C2
SYMATTR Value 10u
SYMBOL AJ_RH 3808 4432 R0
SYMATTR InstName R_FB1
SYMATTR Value 0.15
SYMBOL AJ_LH 4192 4432 R0
SYMATTR InstName L_FB1
SYMATTR Value 90n
SYMBOL AJ_CV 4576 4432 R0
SYMATTR InstName C3
SYMATTR Value 47u
SYMBOL AJ_IV 4960 4432 R0
SYMATTR InstName I_PMT1_PWR
SYMATTR Value 2.7m
SYMBOL AJ_IV 5408 4432 R0
SYMATTR InstName I_PMT2_PWR
SYMATTR Value 2.7m
SYMBOL AJ_BV 2048 4896 R0
SYMATTR InstName B_U2
SYMATTR Value V={min(3.3,max(0,V(V5)-0.35))}
SYMBOL AJ_RH 2496 4896 R0
SYMATTR InstName R_U2
SYMATTR Value 0.12
SYMBOL AJ_CV 2912 4896 R0
SYMATTR InstName C4
SYMATTR Value 1u
SYMBOL AJ_CV 3296 4896 R0
SYMATTR InstName C5
SYMATTR Value 100n
SYMBOL AJ_RH 3680 4896 R0
SYMATTR InstName R_FB2
SYMATTR Value 0.15
SYMBOL AJ_LH 4096 4896 R0
SYMATTR InstName L_FB2
SYMATTR Value 90n
SYMBOL AJ_CV 4512 4896 R0
SYMATTR InstName C6
SYMATTR Value 10u
SYMBOL AJ_CV 2048 5456 R0
SYMATTR InstName C_U3A_100N
SYMATTR Value 100n
SYMBOL AJ_CV 2880 5456 R0
SYMATTR InstName C_U3A_1N
SYMATTR Value 1n
SYMBOL AJ_CV 3712 5456 R0
SYMATTR InstName C_U3B_100N
SYMATTR Value 100n
SYMBOL AJ_CV 4544 5456 R0
SYMATTR InstName C_U3B_1N
SYMATTR Value 1n
SYMBOL AJ_CV 2048 5808 R0
SYMATTR InstName C_U4_100N
SYMATTR Value 100n
SYMBOL AJ_CV 2880 5808 R0
SYMATTR InstName C_U5_100N
SYMATTR Value 100n
SYMBOL AJ_CV 3712 5808 R0
SYMATTR InstName C_U6_100N
SYMATTR Value 100n
SYMBOL AJ_CV 4544 5808 R0
SYMATTR InstName C_U7_100N
SYMATTR Value 100n
SYMBOL AJ_SCHMITT 5184 5408 R0
SYMATTR InstName XU7B
SYMATTR Value SN74LVC2G17
SYMBOL AJ_BV 128 5776 R0
SYMATTR InstName BNS1
SYMATTR Value V={SELS1(time)}
SYMBOL AJ_BV 576 5776 R0
SYMATTR InstName BNS2
SYMATTR Value V={SELS2(time)}
SYMBOL AJ_BV 1024 5776 R0
SYMATTR InstName BNR1
SYMATTR Value V={SELR1(time)}
SYMBOL AJ_BV 1472 5776 R0
SYMATTR InstName BNR2
SYMATTR Value V={SELR2(time)}
TEXT 128 96 Left 4 ;MUON AJ - ASIMETRIK PMT / SCHMITT -> AND / 10mV RMS
TEXT 128 176 Left 2 ;Ana yol: negatif PMT -> 1nF -> 100R -> TLV3601 -> 33R -> SN74LVC2G17 -> SN74LVC1G08
TEXT 128 224 Left 2 ;PW_NS = yarim yukseklik genisligi (FWHM). Devre kaynagi: Rev AG; TI entegre modelleri degistirilmedi.
TEXT 128 368 Left 3 ;KANAL 1 - REF GURULTUSU FILTREDEN SONRA TH GIRISINE SERI EKLENIR
TEXT 128 1136 Left 2 ;N_SIG: 50 ohm portta nominal RMS. Gercek SMA ve INM RMS degerlerini logdan oku.
TEXT 128 1568 Left 3 ;KANAL 2 - REF GURULTUSU FILTREDEN SONRA TH GIRISINE SERI EKLENIR
TEXT 128 2336 Left 2 ;N_SIG: 50 ohm portta nominal RMS. Gercek SMA ve INM RMS degerlerini logdan oku.
TEXT 3408 1072 Left 3 ;COINCIDENCE - AND ONCESINDE SCHMITT VAR
TEXT 3424 1696 Left 2 ;33pF + parazit / 33k + Schmitt: STM icin uzun darbe. Sabit olus suresi garantisi degil.
TEXT 3424 2736 Left 3 ;PMT 1 TEK KANAL SAYIMI
TEXT 3424 3376 Left 3 ;PMT 2 TEK KANAL SAYIMI
TEXT 128 2368 Left 3 ;KANAL 1 - DC BIAS / ESIK (15k, 47R, trim, 15k)
TEXT 128 2816 Left 3 ;KANAL 2 - DC BIAS / ESIK (15k, 47R, trim, 15k)
TEXT 128 3360 Left 3 ;KANAL 1 - GIRIS KORUMA / BAS70 YAKLASIMI
TEXT 128 3776 Left 3 ;KANAL 2 - GIRIS KORUMA / BAS70 YAKLASIMI
TEXT 128 4320 Left 3 ;PMT 1 - VREF=1.2V / VCONT (SENTETIK DARBE GENLIGINI KONTROL ETMEZ)
TEXT 128 4768 Left 3 ;PMT 2 - VREF=1.2V / VCONT (SENTETIK DARBE GENLIGINI KONTROL ETMEZ)
TEXT 2048 4176 Left 3 ;BESLEME - REV AG REGULATOR/FERRIT YAKLASIMLARI KORUNDU
TEXT 2048 5232 Left 3 ;ENTEGRE YAKINI BESLEME KONDANSATORLERI
TEXT 128 5456 Left 3 ;GURULTU SECICILERI - PWL KAYITLARI NOISE_RECORDS.inc ICINDE
TEXT 128 5520 Left 2 ;N_SIG=10m: SMA portta nominal; N_REF=10m: filtreden sonra TH pininde; N_UP: filtre girisi testi.
TEXT 128 6080 Left 2 ;Gurultu kayitlari: Gauss ornekleri, 200MHz FIR alcak geciren filtre, 0.5ns ornek araligi; 5 sabit tohum.
TEXT 128 6144 Left 2 ;Rastgele darbe zamanlari yerine gecikme / yakin atma taramalari var; gonderilen olay zamanlari tam bilinir.
TEXT 3424 96 Left 3 ;05_single_channel_and_noise_only
TEXT 3424 176 Left 2 ;3 kosul | N_SIG / N_REF: sagdaki ayarlar
TEXT 5920 384 Left 3 ;SIMULASYON AYARLARI - YALNIZ BIR .tran
TEXT 5920 496 Left 1 !.include MODELS.inc
TEXT 5920 576 Left 1 !.include NOISE_RECORDS.inc
TEXT 5920 656 Left 1 !.param AMP=100m
TEXT 5920 736 Left 1 !.param PW_NS=20
TEXT 5920 816 Left 1 !.param RATIO2=1
TEXT 5920 896 Left 1 !.param DELAY_NS=0
TEXT 5920 976 Left 1 !.param PAIR_NS=500
TEXT 5920 1056 Left 1 !.param SECOND=0
TEXT 5920 1136 Left 1 !.param ON1={if(MODE==1,1,0)}
TEXT 5920 1216 Left 1 !.param ON2={if(MODE==2,1,0)}
TEXT 5920 1296 Left 1 !.param N_SIG=10m
TEXT 5920 1376 Left 1 !.param N_REF=10m
TEXT 5920 1456 Left 1 !.param N_UP=0
TEXT 5920 1536 Left 1 !.param REF_COMMON=0
TEXT 5920 1616 Left 1 !.param NSEED=1
TEXT 5920 1696 Left 1 !.param RTH1=50
TEXT 5920 1776 Left 1 !.param RTH2=50
TEXT 5920 1856 Left 1 !.param VOS1=0
TEXT 5920 1936 Left 1 !.param VOS2=0
TEXT 5920 2016 Left 1 !.param RATT_VAL=100
TEXT 5920 2096 Left 1 !.param RCL_BOT=1k
TEXT 5920 2176 Left 1 !.param C_AND_LOAD=10p
TEXT 5920 2256 Left 1 !.param C_HOLD_PAR=4p
TEXT 5920 2336 Left 1 !.param VIN_NOM=5.6
TEXT 5920 2416 Left 1 !.param T0=1u
TEXT 5920 2496 Left 1 !.param TSTOP=3u
TEXT 5920 2576 Left 1 !.param TMAX=10p
TEXT 5920 2656 Left 1 !.param K50={(50+49.9)/49.9}
TEXT 5920 2736 Left 1 !.param RNPORT={50*49.9/(50+49.9)}
TEXT 5920 2816 Left 1 !.param MODE=0
TEXT 5920 2896 Left 1 !.step param MODE list 0 1 2
TEXT 5920 2976 Left 1 !.options plotwinsize=0 reltol=0.0002 abstol=1e-12 solver=alt
TEXT 5920 3056 Left 1 !.temp 25
TEXT 5920 3136 Left 1 !.include SAVE_NODES.inc
TEXT 5920 3216 Left 1 !.tran 0 {TSTOP} 0 {TMAX}
TEXT 5920 3296 Left 1 !.include MEASUREMENTS.inc
TEXT 128 6368 Left 2 ;Log: Ctrl+L. Asil sayim cikislari: STM_COINC, STM_SING1, STM_SING2.

The netlist it stands for:
* 05_single_channel_and_noise_only.asc
R104 VTH_W1 TH1_QUIET 1k
BREF1 TH1 TH1_QUIET V={N_REF*V(NR1)}
VOFFSET1 TH1 TH1_OFF {VOS1}
CTH1 TH1_QUIET 0 1p
BPMT1 PMT1_SRC 0 V={-K50*P1(time)}
RSRC1 PMT1_SRC PMT1_SMA 50
R106 PMT1_SMA 0 49.9
BNOISE1 PMT1_SMA 0 I={NI1(time)}
CP1CABLE PMT1_SMA 0 3p
C103 PMT1_SMA C103_OUT 1n
RATT1 C103_OUT INM1 {RATT_VAL}
RBIAS_IN1 INM1 VBIAS1 1k
CIN1 INM1 0 2p
XXU3A TH1_OFF INM1 V3A 0 U3A_OUT TLV3601  ; pins IN+_[3] IN-_[4] VCC_[5] GND_[2] OUT_[1]
R107 U3A_OUT CH1_N1 33
XXU5A CH1_PS CH1_N1 V3D 0 SN74LVC2G17  ; pins Y A VCC GND
R204 VTH_W2 TH2_QUIET 1k
BREF2 TH2 TH2_QUIET V={N_REF*NR2SELECT(time)}
VOFFSET2 TH2 TH2_OFF {VOS2}
CTH2 TH2_QUIET 0 1p
BPMT2 PMT2_SRC 0 V={-K50*P2(time)}
RSRC2 PMT2_SRC PMT2_SMA 50
R206 PMT2_SMA 0 49.9
BNOISE2 PMT2_SMA 0 I={NI2(time)}
CP2CABLE PMT2_SMA 0 3p
C203 PMT2_SMA C203_OUT 1n
RATT2 C203_OUT INM2 {RATT_VAL}
RBIAS_IN2 INM2 VBIAS2 1k
CIN2 INM2 0 2p
XXU3B TH2_OFF INM2 V3A 0 U3B_OUT TLV3601  ; pins IN+_[3] IN-_[4] VCC_[5] GND_[2] OUT_[1]
R207 U3B_OUT CH2_N1 33
XXU5B CH2_PS CH2_N1 V3D 0 SN74LVC2G17  ; pins Y A VCC GND
XXU4 COINC_FAST CH1_PS CH2_PS V3D 0 SN74LVC1G08  ; pins Y_[4] A_[1] B_[2] VCC_[5] GND_[3]
C_AND COINC_FAST 0 {C_AND_LOAD}
R_ANDLEAK COINC_FAST 0 10Meg
D301 COINC_FAST S_COINC BAT54_APPROX
C301 S_COINC 0 33p
C301PAR S_COINC 0 {C_HOLD_PAR}
R301 S_COINC 0 33k
XXU6A COINC_LONG S_COINC V3D 0 SN74LVC2G17  ; pins Y A VCC GND
RMC301 COINC_LONG STM_COINC 33
CMC301 STM_COINC 0 5p
RMCLEAK301 STM_COINC 0 1Meg
D302 CH1_PS S_SINGLE1 BAT54_APPROX
C302 S_SINGLE1 0 33p
C302PAR S_SINGLE1 0 {C_HOLD_PAR}
R302 S_SINGLE1 0 33k
XXU6B SING1_LONG S_SINGLE1 V3D 0 SN74LVC2G17  ; pins Y A VCC GND
RMC302 SING1_LONG STM_SING1 33
CMC302 STM_SING1 0 5p
RMCLEAK302 STM_SING1 0 1Meg
D303 CH2_PS S_SINGLE2 BAT54_APPROX
C303 S_SINGLE2 0 33p
C303PAR S_SINGLE2 0 {C_HOLD_PAR}
R303 S_SINGLE2 0 33k
XXU7A SING2_LONG S_SINGLE2 V3D 0 SN74LVC2G17  ; pins Y A VCC GND
RMC303 SING2_LONG STM_SING2 33
CMC303 STM_SING2 0 5p
RMCLEAK303 STM_SING2 0 1Meg
R101 V3A VBIAS1 15k
R102 VBIAS1 TTOP1 47
RTH_TRIM1 TTOP1 VTH_W1 {RTH1}
R103 VTH_W1 REF_RETURN1 15k
BREFUP1 REF_RETURN1 0 V={N_UP*V(NR1)}
C101 VBIAS1 0 1u
C102 VTH_W1 0 100n
R201 V3A VBIAS2 15k
R202 VBIAS2 TTOP2 47
RTH_TRIM2 TTOP2 VTH_W2 {RTH2}
R203 VTH_W2 REF_RETURN2 15k
BREFUP2 REF_RETURN2 0 V={N_UP*V(NR2)}
C201 VBIAS2 0 1u
C202 VTH_W2 0 100n
D401 CLAMPREF1 INM1 BAS70_REVU
D402 INM1 V3A BAS70_REVU
RCL_TOP1 V3A CLAMPREF1 12k
RCL_BOT1 CLAMPREF1 0 {RCL_BOT}
CCL_1U1 CLAMPREF1 0 1u
CCL_100N1 CLAMPREF1 0 100n
D403 CLAMPREF2 INM2 BAS70_REVU
D404 INM2 V3A BAS70_REVU
RCL_TOP2 V3A CLAMPREF2 12k
RCL_BOT2 CLAMPREF2 0 {RCL_BOT}
CCL_1U2 CLAMPREF2 0 1u
CCL_100N2 CLAMPREF2 0 100n
VREF1 REF1 0 1.2
R121 REF1 VCTOP1 3.3k
RVR121_TOP VCTOP1 VCONT1 5k
RVR121_BOT VCONT1 VCBOT1 5k
R122 VCBOT1 0 11k
C121 VCONT1 0 100n
R_VCONT_LOAD1 VCONT1 0 1Meg
VREF2 REF2 0 1.2
R221 REF2 VCTOP2 3.3k
RVR221_TOP VCTOP2 VCONT2 5k
RVR221_BOT VCONT2 VCBOT2 5k
R222 VCBOT2 0 11k
C221 VCONT2 0 100n
R_VCONT_LOAD2 VCONT2 0 1Meg
V_IN VIN 0 {VIN_NOM}
C1 VIN 0 10u
B_U1 V5RAW 0 V={min(5,max(0,V(VIN)-0.35))}
R_U1 V5RAW V5 0.12
C2 V5 0 10u
R_FB1 V5 V5FB 0.15
L_FB1 V5FB V5PMT 90n
C3 V5PMT 0 47u
I_PMT1_PWR V5PMT 0 2.7m
I_PMT2_PWR V5PMT 0 2.7m
B_U2 V3RAW 0 V={min(3.3,max(0,V(V5)-0.35))}
R_U2 V3RAW V3D 0.12
C4 V3D 0 1u
C5 V3D 0 100n
R_FB2 V3D V3FB 0.15
L_FB2 V3FB V3A 90n
C6 V3A 0 10u
C_U3A_100N V3A 0 100n
C_U3A_1N V3A 0 1n
C_U3B_100N V3A 0 100n
C_U3B_1N V3A 0 1n
C_U4_100N V3D 0 100n
C_U5_100N V3D 0 100n
C_U6_100N V3D 0 100n
C_U7_100N V3D 0 100n
XXU7B UNUSED_Y 0 V3D 0 SN74LVC2G17  ; pins Y A VCC GND
BNS1 NS1 0 V={SELS1(time)}
BNS2 NS2 0 V={SELS2(time)}
BNR1 NR1 0 V={SELR1(time)}
BNR2 NR2 0 V={SELR2(time)}
.model D D
.lib standard.dio
* MUON AJ - ASIMETRIK PMT / SCHMITT -> AND / 10mV RMS
* Ana yol: negatif PMT -> 1nF -> 100R -> TLV3601 -> 33R -> SN74LVC2G17 -> SN74LVC1G08
* PW_NS = yarim yukseklik genisligi (FWHM). Devre kaynagi: Rev AG; TI entegre modelleri degistirilmedi.
* KANAL 1 - REF GURULTUSU FILTREDEN SONRA TH GIRISINE SERI EKLENIR
* N_SIG: 50 ohm portta nominal RMS. Gercek SMA ve INM RMS degerlerini logdan oku.
* KANAL 2 - REF GURULTUSU FILTREDEN SONRA TH GIRISINE SERI EKLENIR
* N_SIG: 50 ohm portta nominal RMS. Gercek SMA ve INM RMS degerlerini logdan oku.
* COINCIDENCE - AND ONCESINDE SCHMITT VAR
* 33pF + parazit / 33k + Schmitt: STM icin uzun darbe. Sabit olus suresi garantisi degil.
* PMT 1 TEK KANAL SAYIMI
* PMT 2 TEK KANAL SAYIMI
* KANAL 1 - DC BIAS / ESIK (15k, 47R, trim, 15k)
* KANAL 2 - DC BIAS / ESIK (15k, 47R, trim, 15k)
* KANAL 1 - GIRIS KORUMA / BAS70 YAKLASIMI
* KANAL 2 - GIRIS KORUMA / BAS70 YAKLASIMI
* PMT 1 - VREF=1.2V / VCONT (SENTETIK DARBE GENLIGINI KONTROL ETMEZ)
* PMT 2 - VREF=1.2V / VCONT (SENTETIK DARBE GENLIGINI KONTROL ETMEZ)
* BESLEME - REV AG REGULATOR/FERRIT YAKLASIMLARI KORUNDU
* ENTEGRE YAKINI BESLEME KONDANSATORLERI
* GURULTU SECICILERI - PWL KAYITLARI NOISE_RECORDS.inc ICINDE
* N_SIG=10m: SMA portta nominal; N_REF=10m: filtreden sonra TH pininde; N_UP: filtre girisi testi.
* Gurultu kayitlari: Gauss ornekleri, 200MHz FIR alcak geciren filtre, 0.5ns ornek araligi; 5 sabit tohum.
* Rastgele darbe zamanlari yerine gecikme / yakin atma taramalari var; gonderilen olay zamanlari tam bilinir.
* 05_single_channel_and_noise_only
* 3 kosul | N_SIG / N_REF: sagdaki ayarlar
* SIMULASYON AYARLARI - YALNIZ BIR .tran
.include MODELS.inc
.include NOISE_RECORDS.inc
.param AMP=100m
.param PW_NS=20
.param RATIO2=1
.param DELAY_NS=0
.param PAIR_NS=500
.param SECOND=0
.param ON1={if(MODE==1,1,0)}
.param ON2={if(MODE==2,1,0)}
.param N_SIG=10m
.param N_REF=10m
.param N_UP=0
.param REF_COMMON=0
.param NSEED=1
.param RTH1=50
.param RTH2=50
.param VOS1=0
.param VOS2=0
.param RATT_VAL=100
.param RCL_BOT=1k
.param C_AND_LOAD=10p
.param C_HOLD_PAR=4p
.param VIN_NOM=5.6
.param T0=1u
.param TSTOP=3u
.param TMAX=10p
.param K50={(50+49.9)/49.9}
.param RNPORT={50*49.9/(50+49.9)}
.param MODE=0
.step param MODE list 0 1 2
.options plotwinsize=0 reltol=0.0002 abstol=1e-12 solver=alt
.temp 25
.include SAVE_NODES.inc
.tran 0 {TSTOP} 0 {TMAX}
.include MEASUREMENTS.inc
* Log: Ctrl+L. Asil sayim cikislari: STM_COINC, STM_SING1, STM_SING2.
.backanno
.end